# Altium schematic sheet Fuente_1.SchDoc
size A4; SheetNumber: 1; SheetTotal: 1
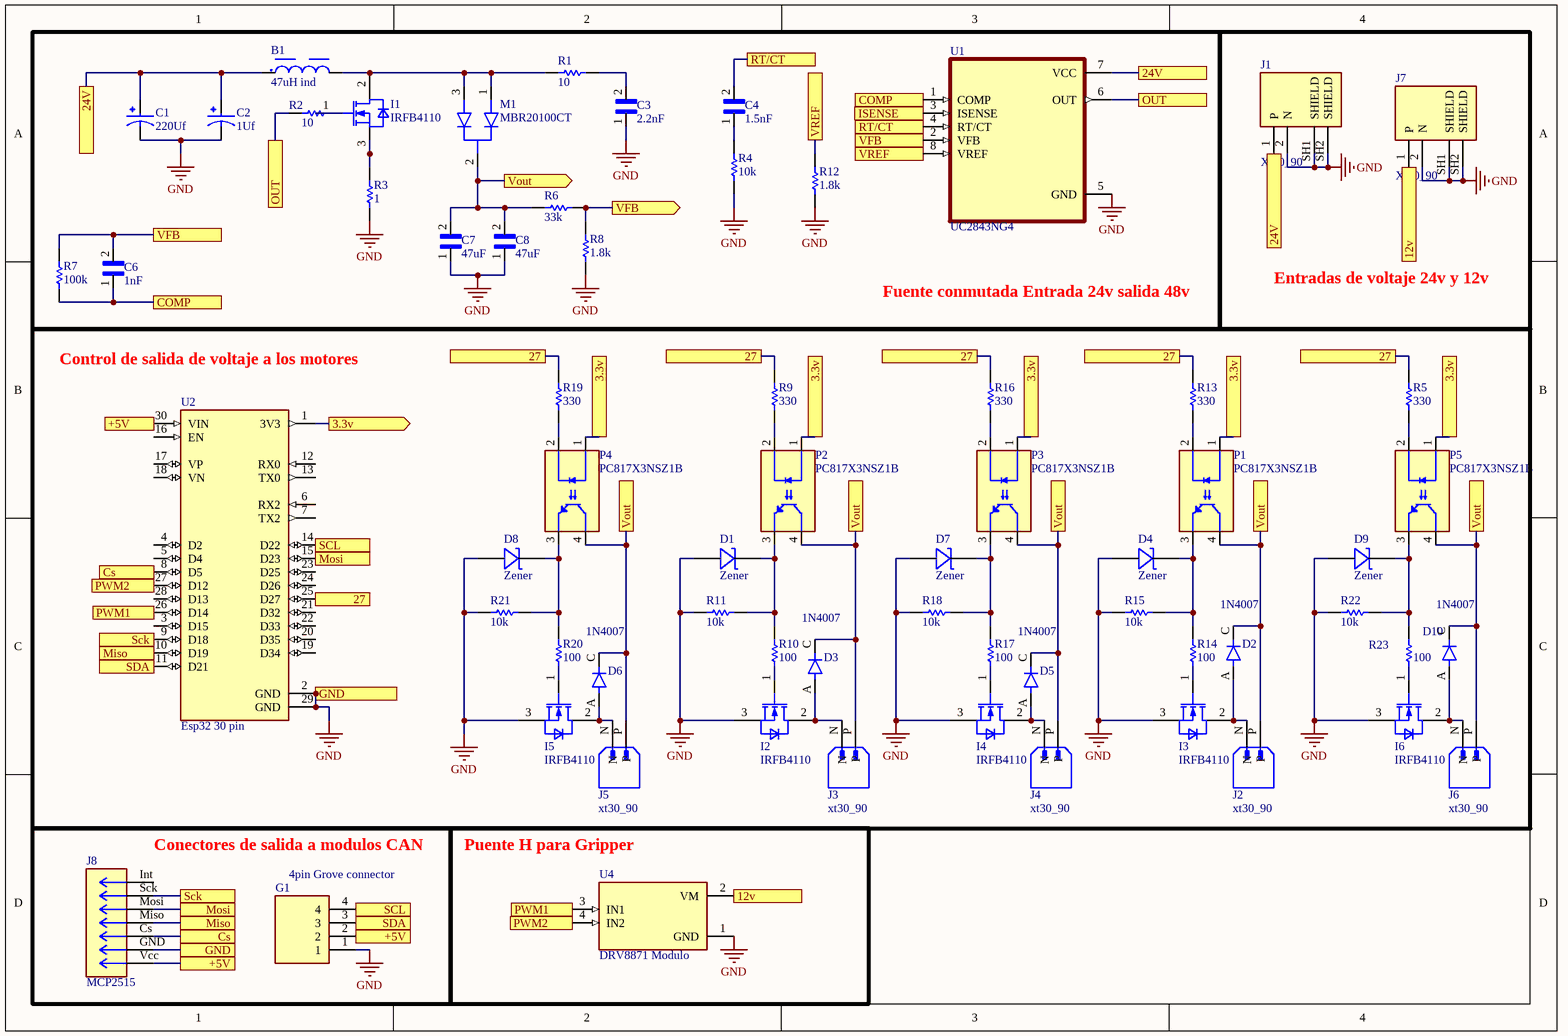
[diagram p0: Fuente_1.SchDoc]

## Parts
B1  47uH ind  [47uH]
C1  220Uf  [Cap-Electrolitico]
C2  1Uf  [Cap-Electrolitico]
C3  2.2nF  [Ceramic_CAP]
C4  1.5nF  [Ceramic_CAP]
C6  1nF  [Ceramic_CAP]
C7  47uF  [Ceramic_CAP]
C8  47uF  [Ceramic_CAP]
D1  Zener  [Zener]
D2  1N4007  [1N4007]
D3  1N4007  [1N4007]
D4  Zener  [Zener]
D5  1N4007  [1N4007]
D6  1N4007  [1N4007]
D7  Zener  [Zener]
D8  Zener  [Zener]
D9  Zener  [Zener]
D10  1N4007  [1N4007]
G1  4pin Grove connector  [4 pin grove conector]
I1  IRFB4110  [IRFB4110]
I2  IRFB4110  [IRFB4110]
I3  IRFB4110  [IRFB4110]
I4  IRFB4110  [IRFB4110]
I5  IRFB4110  [IRFB4110]
I6  IRFB4110  [IRFB4110]
J1  Xt60_90  [Xt60_90]
J2  xt30_90  [XT30_90]
J3  xt30_90  [XT30_90]
J4  xt30_90  [XT30_90]
J5  xt30_90  [XT30_90]
J6  xt30_90  [XT30_90]
J7  Xt60_90  [Xt60_90]
J8  MCP2515  [MCP2515]
M1  MBR20100CT  [MBR20100CT]
P1  PC817X3NSZ1B  [PC817X3NSZ1B]
P2  PC817X3NSZ1B  [PC817X3NSZ1B]
P3  PC817X3NSZ1B  [PC817X3NSZ1B]
P4  PC817X3NSZ1B  [PC817X3NSZ1B]
P5  PC817X3NSZ1B  [PC817X3NSZ1B]
R1  10  [Resistor_U]
R2  10  [Resistor_U]
R3  1  [Resistor_U]
R4  10k  [Resistor_U]
R5  330  [Resistor_U]
R6  33k  [Resistor_U]
R7  100k  [Resistor_U]
R8  1.8k  [Resistor_U]
R9  330  [Resistor_U]
R10  100  [Resistor_U]
R11  10k  [Resistor_U]
R12  1.8k  [Resistor_U]
R13  330  [Resistor_U]
R14  100  [Resistor_U]
R15  10k  [Resistor_U]
R16  330  [Resistor_U]
R17  100  [Resistor_U]
R18  10k  [Resistor_U]
R19  330  [Resistor_U]
R20  100  [Resistor_U]
R21  10k  [Resistor_U]
R22  10k  [Resistor_U]
R23  100  [Resistor_U]
U1  UC2843NG4  [UC3843]
U2  Esp32 30 pin  [ESP32 30 pin]
U4  DRV8871 Modulo  [DRV8871 Modulo]

## Blocks framed on the sheet
Fuente conmutada Entrada 24v salida 48v: B1 C1-C4 C6-C8 I1 M1 R1-R4 R6-R8 R12 U1
Entradas de voltaje 24v y 12v: J1 J7
Control de salida de voltaje a los motores: D1-D10 I2-I6 J2-J6 P1-P5 R5 R9-R11 R13-R23 U2
Conectores de salida a modulos CAN: G1 J8
Puente H para Gripper: U4

## Ports
3.3v (out, see Fuente_1[2B], Fuente_1[3B], Fuente_1[4B]), 3.3v (see Fuente_1[1B], Fuente_1[2B], Fuente_1[3B], Fuente_1[4B]), 3.3v (see Fuente_1[1B], Fuente_1[3B], Fuente_1[4B]), 12v (see Fuente_1[2D]), 12v (see Fuente_1[4B]), 24V (see Fuente_1[1A], Fuente_1[3A]), 24V (see Fuente_1[1A], Fuente_1[4A]), 24V (see Fuente_1[3A], Fuente_1[4A]), 27 (see Fuente_1[1C], Fuente_1[2B], Fuente_1[3B]), 27 (see Fuente_1[1C], Fuente_1[2B], Fuente_1[3B], Fuente_1[4B]), 27 (see Fuente_1[2B], Fuente_1[3B], Fuente_1[4B]), +5V (see Fuente_1[1B], Fuente_1[1D]), +5V (see Fuente_1[1D]), COMP (see Fuente_1[1B]), COMP (see Fuente_1[3A]), Cs (see Fuente_1[1C]), Cs (see Fuente_1[1D]), GND (see Fuente_1[1C]), GND (see Fuente_1[1D]), ISENSE, Miso (see Fuente_1[1C]), Miso (see Fuente_1[1D]), Mosi (see Fuente_1[1C]), Mosi (see Fuente_1[1D]), OUT (see Fuente_1[1A]), OUT (see Fuente_1[3A]), PWM1 (see Fuente_1[1C]), PWM1 (see Fuente_1[2D]), PWM2 (see Fuente_1[1C]), PWM2 (see Fuente_1[2D]), RT/CT (see Fuente_1[2A]), RT/CT (see Fuente_1[3A]), Sck (see Fuente_1[1C]), Sck (see Fuente_1[1D]), SCL (see Fuente_1[1C]), SCL (see Fuente_1[1D]), SDA (see Fuente_1[1C]), SDA (see Fuente_1[1D]), VFB (out, see Fuente_1[1A], Fuente_1[3A]), VFB (see Fuente_1[1A], Fuente_1[2A]), VFB (see Fuente_1[2A], Fuente_1[3A]), Vout (out, see Fuente_1[2C], Fuente_1[3C], Fuente_1[4C]), Vout (see Fuente_1[2A], Fuente_1[2C], Fuente_1[3C], Fuente_1[4C]), Vout (see Fuente_1[2A], Fuente_1[3C], Fuente_1[4C]), VREF (see Fuente_1[3A])

## Nets
GND: C1.N C2.N C3.1 C7.1 C8.1 D1.A D4.A D7.A D8.A D9.A G1.1 I2.3(SOURCE) I3.3(SOURCE) I4.3(SOURCE) I5.3(SOURCE) I6.3(SOURCE) J1.2(N) J1.SH1(SHIELD) J1.SH2(SHIELD) J7.2(N) J7.SH1(SHIELD) J7.SH2(SHIELD) J8.GND R3.1 R4.1 R8.1 R11.2 R12.1 R15.2 R18.2 R21.2 R22.2 U1.5(GND) U2.2(GND) U2.29(GND) U4.1(GND) ; port GND
3.3v: P1.1(ANODE) P2.1(ANODE) P3.1(ANODE) P4.1(ANODE) P5.1(ANODE) U2.1(3V3) ; port 3.3v
12v: J7.1(P) U4.2(VM) ; port 12v
24V: B1.1 C1.P C2.P J1.1(P) U1.7(VCC) ; port 24V
27: R5.2 R9.2 R13.2 R16.2 R19.2 U2.25(D27) ; port 27
+5V: G1.2 J8.Vcc U2.30(VIN) ; port +5V
COMP: C6.1 R7.1 U1.1(COMP) ; port COMP
Cs: J8.Cs U2.8(D5) ; port Cs
ISENSE: U1.3(ISENSE) ; port ISENSE
Miso: J8.Miso U2.10(D19) ; port Miso
Mosi: J8.Mosi U2.15(D23) ; port Mosi
OUT: R2.1 U1.6(OUT) ; port OUT
PWM1: U2.26(D14) U4.3(IN1) ; port PWM1
PWM2: U2.27(D12) U4.4(IN2) ; port PWM2
RT/CT: C4.2 U1.4(RT/CT) ; port RT/CT
Sck: J8.Sck U2.9(D18) ; port Sck
SCL: G1.4 U2.14(D22) ; port SCL
SDA: G1.3 U2.11(D21) ; port SDA
VFB: C6.2 R6.1 R7.2 R8.2 U1.2(VFB) ; port VFB
Vout: C7.2 C8.2 D2.C D3.C D5.C D6.C D10.C J2.P J3.P J4.P J5.P J6.P M1.2(COMMON_CATHODE) P1.4(COLLECTOR) P2.4(COLLECTOR) P3.4(COLLECTOR) P4.4(COLLECTOR) P5.4(COLLECTOR) R6.2 ; port Vout
VREF: R12.2 U1.8(VREF) ; port VREF
NetB1_2: B1.2 I1.2(DRAIN) M1.1(ANODE1) M1.3(ANODE2) R1.1
NetC3_2: C3.2 R1.2
NetC4_1: C4.1 R4.2
NetD1_C: D1.C P2.3(EMITTER) R10.2 R11.1
NetD2_A: D2.A I3.2(DRAIN) J2.N
NetD3_A: D3.A I2.2(DRAIN) J3.N
NetD4_C: D4.C P1.3(EMITTER) R14.2 R15.1
NetD5_A: D5.A I4.2(DRAIN) J4.N
NetD6_A: D6.A I5.2(DRAIN) J5.N
NetD7_C: D7.C P3.3(EMITTER) R17.2 R18.1
NetD8_C: D8.C P4.3(EMITTER) R20.2 R21.1
NetD9_C: D9.C P5.3(EMITTER) R22.1 R23.2
NetD10_A: D10.A I6.2(DRAIN) J6.N
NetI1_1: I1.1(GATE) R2.2
NetI1_3: I1.3(SOURCE) R3.2
NetI2_1: I2.1(GATE) R10.1
NetI3_1: I3.1(GATE) R14.1
NetI4_1: I4.1(GATE) R17.1
NetI5_1: I5.1(GATE) R20.1
NetI6_1: I6.1(GATE) R23.1
NetP1_2: P1.2(CATHODE) R13.1
NetP2_2: P2.2(CATHODE) R9.1
NetP3_2: P3.2(CATHODE) R16.1
NetP4_2: P4.2(CATHODE) R19.1
NetP5_2: P5.2(CATHODE) R5.1

Not connected (* = marked no-connect by the designer): J8 Int(7); U2 3(D15) 4(D2) 5(D4) 6(RX2) 7(TX2) 12(RX0) 13(TX0) 16(EN) 17(VP) 18(VN) 19(D34) 20(D35) 21(D32) 22(D33) 23(D25) 24(D26) 28(D13)

## Library data of the parts
C1 C2 = Cap Electrolitico
C3 C4 C6-C8 = Ceramic_Cap
R1-R23 = Resistor_U
U2 = Esp32 30 pin: Dual core, Wi-Fi: 2.4 GHz up to 150 Mbits/s,BLE (Bluetooth Low Energy) and legacy Bluetooth, 32 bits, Up to 240 MHz